# Altium project adau1979-fpga.PrjPcb (part 2 of 6)
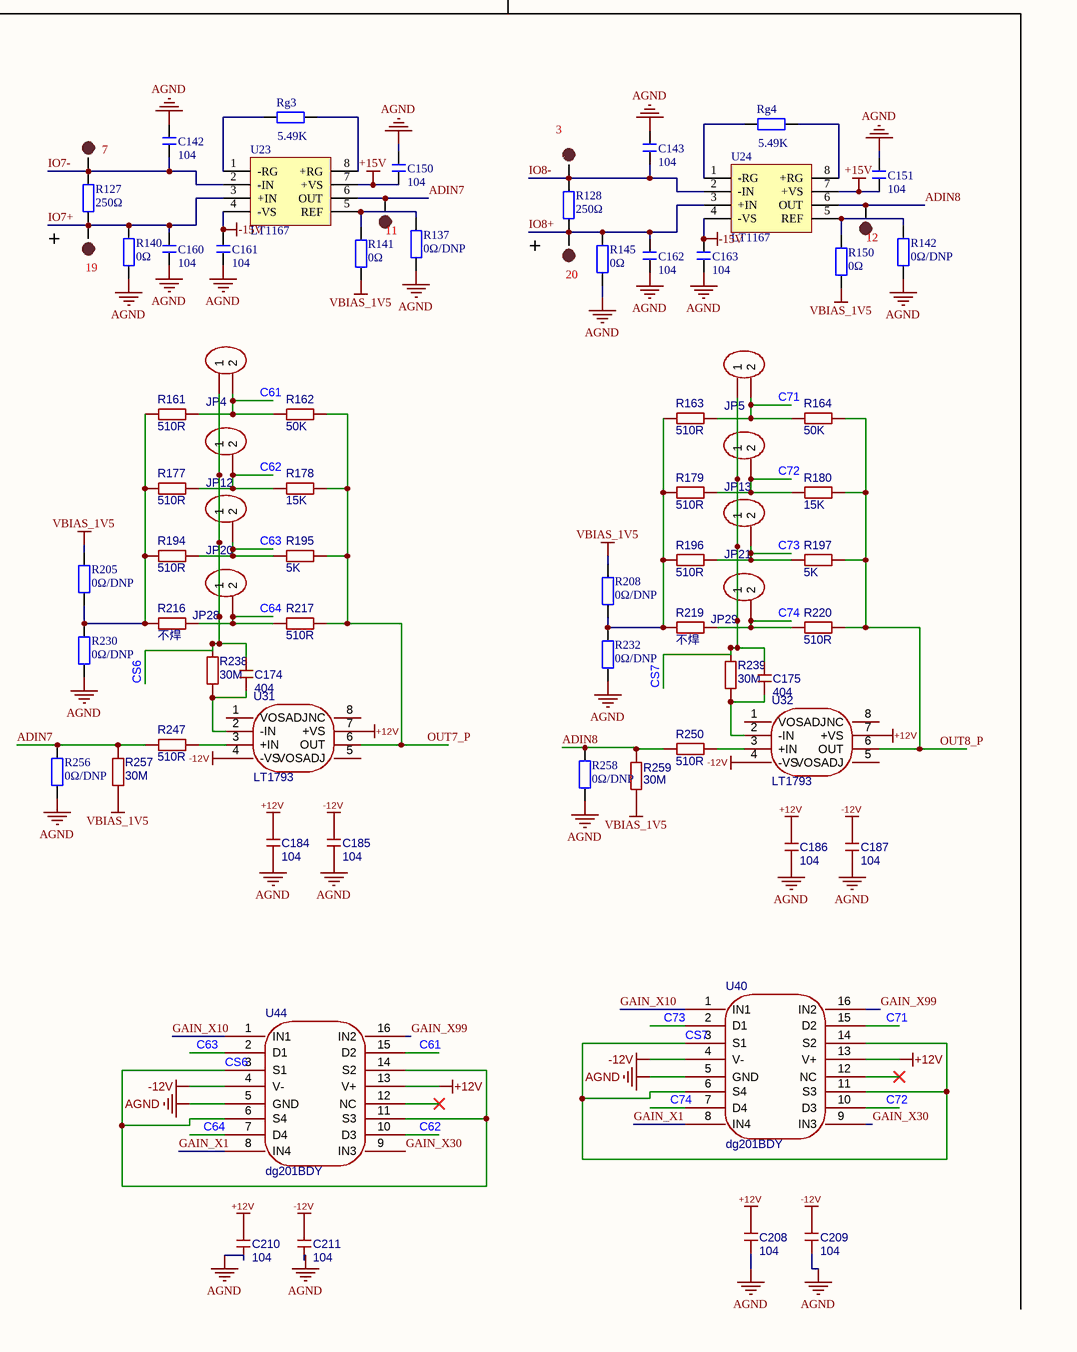
[diagram p8: adau1979_fpga.SchDoc, bottom right]
## Sheet adau1979_fpga.SchDoc (continued)
### Library data of the parts
1-24 +1 +2 -1--3 T1 = TEST-POINT: 测试点
C1-C7 = C: 贴片电容; BOM名称: 无极性贴片电容; 淘宝ID: 封装库来自淘宝 ID：黄晶宝石; Origin Footprint: C 0201_L; OriginFootprint 2: C 0402_L; OriginFootprint 3: C 0805_L; OriginFootprint 4: C 1206_L; OriginFootprint 5: C 1210_L; OriginFootprint 6: C 1808_L; OriginFootprint 7: C 1812_L; OriginFootprint 8: C 1825_L; OriginFootprint 9: C 2225_L; OriginFootprint 10: C 0201_M; OriginFootprint 11: C 0402_M; OriginFootprint 12: C 0603_M; OriginFootprint 13: C 0805_M; OriginFootprint 14: C 1206_M; OriginFootprint 15: C 1210_M; OriginFootprint 16: C 1808_M; OriginFootprint 17: C 1812_M; OriginFootprint 18: C 1825_M; OriginFootprint 19: C 2225_M; AddInBom: yes; OriginModelName: C 0603; Device: C; 联系售后，技术支持: https://shop463601444.taobao.com; 唯一出售店铺网址: https://shop463601444.taobao.com; DesignItemID: C; LibraryName: 0.1 - 电阻-电容-电感; Symbol: C; FootprintName: C 0603_L
C8-C13 C16-C29 C75 C77 C84-C86 C89 C91-C94 C102-C106 C110 C111 C113 C116 C118 C127-C130 C132 C133 C140-C171 = C: 贴片电容; BOM名称: 无极性贴片电容; 淘宝ID: 封装库来自淘宝 ID：黄晶宝石; 联系售后，技术支持: https://shop463601444.taobao.com; 唯一出售店铺网址: https://shop463601444.taobao.com
C14 C15 = CE_SMD: 贴片电解电容; 版权归属: 封装库来自淘宝 ID：黄晶宝石; BOM名称: 贴片电解电容; 联系售后: https://shop463601444.taobao.com
C30-C39 C41 C42 C45 C46 C48 C50 C53 C59 C61 C62 C66-C68 C71 C74 C78 C80 C81 C87 C90 C95 C98-C100 C108 C112 C115 C119 C120 C123 C125 C126 C134 C136 C138 C139 = C: 无极性贴片电容; 版权归属: 源创客; BOM名称: 无极性贴片电容; 学习资源: www.ooocke.com
C40 C52 C88 C131 = CAP_2
C43 C44 C47 C49 C54 C56 = CAP
C51 C64 C76 C83 C101 C109 C117 C124 = fs32x106k101egg: 容值:10uF;精度:±10%;额定电压:100V;温度系数:X7R;; Manufacturer: PSA(信昌电陶); AddInBom: yes; ModelId: 833068e7fe044595a6eec77c56179455; ModelName: C1210_L3.2-W2.5-H2.5; ModelTransform: 125.984,98.425,0,0,0,0,0,0,0; Tolerance: ±10%; Voltage Rating: 100V; Temperature Coefficient: X7R; Symbol: FS32X106K101EGG; LCSC Part Name: 10uF ±10% 100V; SupplierPart: C5156756; ManufacturerPart: FS32X106K101EGG; Supplier Footprint: 1210; JLCPCB Part Class: Extended Part; Datasheet: https://item.szlcsc.com/datasheet/FS32X106K101EGG/5791227.html; Supplier: LCSC; ConvertToPcb: yes; FootprintName: C1210; Value: 10uF
C55 C57 = Cap: Capacitor; Value: 104; Published: 8-Jun-2000; LatestRevisionDate: 17-Jul-2002; LatestRevisionNote: Re-released for DXP Platform.; Publisher: Altium Limited
C58 C73 C79 C97 C107 C114 C122 C137 = fs32x106k101egg: 容值:10uF;精度:±10%;额定电压:100V;温度系数:X7R;; Manufacturer: PSA(信昌电陶); AddInBom: yes; ModelId: 833068e7fe044595a6eec77c56179455; ModelName: C1210_L3.2-W2.5-H2.5; ModelTransform: 125.984,98.425,0,0,0,0,0,0,0; Value: 10uF; Tolerance: ±10%; Voltage Rating: 100V; Temperature Coefficient: X7R; Symbol: FS32X106K101EGG; LCSC Part Name: 10uF ±10% 100V; SupplierPart: C5156756; ManufacturerPart: FS32X106K101EGG; Supplier Footprint: 1210; JLCPCB Part Class: Extended Part; Datasheet: https://item.szlcsc.com/datasheet/FS32X106K101EGG/5791227.html; Supplier: LCSC; ConvertToPcb: yes; FootprintName: C1210
C60 C65 = 100yxj10m6.3x11: 容值:10uF;精度:±20%;额定电压:100V;纹波电流:112.14mA@120Hz;等效串联电阻(ESR):570mΩ;; Manufacturer: Rubycon(红宝石); AddInBom: yes; ModelId: 3cdd55eab6a840dba93006d5a727d063; ModelTransform: 247.778,247.90446,0,0,0,0,0,0,-137.795; Tolerance: ±20%; Voltage Rating: 100V; Equivalent Series Resistance(ESR): 570mΩ; Pin Spacing: 2.5mm; Lifetime: 7000hrs@105℃; Symbol: 100YXJ10M6.3X11; LCSC Part Name: 10uF ±20% 100V; SupplierPart: C1668981; ManufacturerPart: 100YXJ10M6.3X11; Supplier Footprint: 插件,D6.3xL11mm; JLCPCB Part Class: Extended Part; Supplier: LCSC; ConvertToPcb: yes; FootprintName: CAP-TH_BD6.3-P2.50-D0.6-FD; ModelName: CAP-TH_BD6.3-P2.50-D0.6-FD; Value: 10uF; Ripple Current: 112.14mA@120Hz; Diameter: 6.3mm; Height - Seated (Max): 11mm; Operating Temperature: -40℃~+105℃
C63 C69 C70 = eeufr1h101: 容值:100uF;精度:±20%;额定电压:50V;纹波电流:870mA@100kHz;等效串联电阻(ESR):61mΩ@100kHz;; Manufacturer: PANASONIC(松下); AddInBom: yes; ModelId: 5fc21599cab34df2ad7753b19b2f5286; ModelTransform: 315.365,314.914,0,0,0,0,0,0,-196.85; Tolerance: ±20%; Voltage Rating: 50V; Pin Spacing: 3.5mm; Lifetime: 6000hrs@105℃; Polarity type: 有极性; Symbol: EEUFR1H101; LCSC Part Name: 100uF ±20% 50V; SupplierPart: C178702; ManufacturerPart: EEUFR1H101; Supplier Footprint: 插件,D8xL11.5mm; JLCPCB Part Class: Extended Part; Datasheet: https://item.szlcsc.com/datasheet/EEUFR1H101/190095.html; Supplier: LCSC; ConvertToPcb: yes; FootprintName: CAP-TH_BD8.0-P3.50-D0.6-FD_1; ModelName: CAP-TH_BD8.0-P3.50-D0.6-FD_1; Value: 100uF; Ripple Current: 870mA@100kHz; Equivalent Series Resistance(ESR): 61mΩ@100kHz; Diameter: 8mm; Height - Seated (Max): 11.5mm; Operating Temperature: -40℃~+105℃
C72 = cl31b475kbhnnne: 容值:4.7uF;精度:±10%;额定电压:50V;温度系数:X7R;; Manufacturer: SAMSUNG(三星); AddInBom: yes; ModelId: e4be705b945545a48e666415e3682bd8; ModelName: C1206_L3.2-W1.6-H1.3; ModelTransform: 125.984,62.992,0,0,0,0,0,0,0; Tolerance: ±10%; Voltage Rating: 50V; Temperature Coefficient: X7R; Symbol: CL31B475KBHNNNE; LCSC Part Name: 4.7uF ±10% 50V; SupplierPart: C51205; ManufacturerPart: CL31B475KBHNNNE; Supplier Footprint: 1206; JLCPCB Part Class: Extended Part; Datasheet: https://item.szlcsc.com/datasheet/CL31B475KBHNNNE/52218.html; Supplier: LCSC; ConvertToPcb: yes; FootprintName: C1206; Value: 4.7uF
C82 C96 C121 C135 = cl31b106kahnnne: 容值:10uF;精度:±10%;额定电压:25V;温度系数:X7R;; Manufacturer: SAMSUNG(三星); AddInBom: yes; ModelId: e4be705b945545a48e666415e3682bd8; ModelName: C1206_L3.2-W1.6-H1.3; ModelTransform: 125.984,62.992,0,0,0,0,0,0,0; Tolerance: ±10%; Voltage Rating: 25V; Temperature Coefficient: X7R; Symbol: CL31B106KAHNNNE; LCSC Part Name: 10uF ±10% 25V; SupplierPart: C14860; ManufacturerPart: CL31B106KAHNNNE; Supplier Footprint: 1206; JLCPCB Part Class: Extended Part; Datasheet: https://item.szlcsc.com/datasheet/CL31B106KAHNNNE/15532.html; Supplier: LCSC; ConvertToPcb: yes; FootprintName: C1206; Value: 10uF
C172 = C: 贴片电容; BOM名称: 无极性贴片电容; 淘宝ID: 封装库来自淘宝 ID：黄晶宝石; Origin Footprint: C 0201_L; OriginFootprint 2: C 0402_L; OriginFootprint 3: C 0805_L; OriginFootprint 4: C 1206_L; OriginFootprint 5: C 1210_L; OriginFootprint 6: C 1808_L; OriginFootprint 7: C 1812_L; OriginFootprint 8: C 1825_L; OriginFootprint 9: C 2225_L; OriginFootprint 10: C 0201_M; OriginFootprint 11: C 0402_M; OriginFootprint 12: C 0603_M; OriginFootprint 13: C 0805_M; OriginFootprint 14: C 1206_M; OriginFootprint 15: C 1210_M; OriginFootprint 16: C 1808_M; OriginFootprint 17: C 1812_M; OriginFootprint 18: C 1825_M; OriginFootprint 19: C 2225_M; UniqueId: 2b2365c2d0e3ae99; AddInBom: yes; OriginModelName: C 0603; Device: C; 联系售后，技术支持: https://shop463601444.taobao.com; 唯一出售店铺网址: https://shop463601444.taobao.com; DesignItemID: C; LibraryName: 0.1 - 电阻-电容-电感; SymbolName: C; FootprintName: C 0603_L
C173 = C: 贴片电容; BOM名称: 无极性贴片电容; 淘宝ID: 封装库来自淘宝 ID：黄晶宝石; Origin Footprint: C 0201_L; OriginFootprint 2: C 0402_L; OriginFootprint 3: C 0805_L; OriginFootprint 4: C 1206_L; OriginFootprint 5: C 1210_L; OriginFootprint 6: C 1808_L; OriginFootprint 7: C 1812_L; OriginFootprint 8: C 1825_L; OriginFootprint 9: C 2225_L; OriginFootprint 10: C 0201_M; OriginFootprint 11: C 0402_M; OriginFootprint 12: C 0603_M; OriginFootprint 13: C 0805_M; OriginFootprint 14: C 1206_M; OriginFootprint 15: C 1210_M; OriginFootprint 16: C 1808_M; OriginFootprint 17: C 1812_M; OriginFootprint 18: C 1825_M; OriginFootprint 19: C 2225_M; UniqueId: 2ac4a713bdb27458; AddInBom: yes; OriginModelName: C 0603; Device: C; 联系售后，技术支持: https://shop463601444.taobao.com; 唯一出售店铺网址: https://shop463601444.taobao.com; DesignItemID: C; LibraryName: 0.1 - 电阻-电容-电感; SymbolName: C; FootprintName: C 0603_L
C174 = C: 贴片电容; BOM名称: 无极性贴片电容; 淘宝ID: 封装库来自淘宝 ID：黄晶宝石; Origin Footprint: C 0201_L; OriginFootprint 2: C 0402_L; OriginFootprint 3: C 0805_L; OriginFootprint 4: C 1206_L; OriginFootprint 5: C 1210_L; OriginFootprint 6: C 1808_L; OriginFootprint 7: C 1812_L; OriginFootprint 8: C 1825_L; OriginFootprint 9: C 2225_L; OriginFootprint 10: C 0201_M; OriginFootprint 11: C 0402_M; OriginFootprint 12: C 0603_M; OriginFootprint 13: C 0805_M; OriginFootprint 14: C 1206_M; OriginFootprint 15: C 1210_M; OriginFootprint 16: C 1808_M; OriginFootprint 17: C 1812_M; OriginFootprint 18: C 1825_M; OriginFootprint 19: C 2225_M; UniqueId: 043006a40a259ae3; AddInBom: yes; OriginModelName: C 0603; Device: C; 联系售后，技术支持: https://shop463601444.taobao.com; 唯一出售店铺网址: https://shop463601444.taobao.com; DesignItemID: C; LibraryName: 0.1 - 电阻-电容-电感; SymbolName: C; FootprintName: C 0603_L
C175 = C: 贴片电容; BOM名称: 无极性贴片电容; 淘宝ID: 封装库来自淘宝 ID：黄晶宝石; Origin Footprint: C 0201_L; OriginFootprint 2: C 0402_L; OriginFootprint 3: C 0805_L; OriginFootprint 4: C 1206_L; OriginFootprint 5: C 1210_L; OriginFootprint 6: C 1808_L; OriginFootprint 7: C 1812_L; OriginFootprint 8: C 1825_L; OriginFootprint 9: C 2225_L; OriginFootprint 10: C 0201_M; OriginFootprint 11: C 0402_M; OriginFootprint 12: C 0603_M; OriginFootprint 13: C 0805_M; OriginFootprint 14: C 1206_M; OriginFootprint 15: C 1210_M; OriginFootprint 16: C 1808_M; OriginFootprint 17: C 1812_M; OriginFootprint 18: C 1825_M; OriginFootprint 19: C 2225_M; UniqueId: ed052c5890e059ff; AddInBom: yes; OriginModelName: C 0603; Device: C; 联系售后，技术支持: https://shop463601444.taobao.com; 唯一出售店铺网址: https://shop463601444.taobao.com; DesignItemID: C; LibraryName: 0.1 - 电阻-电容-电感; SymbolName: C; FootprintName: C 0603_L
C176 = C: 贴片电容; BOM名称: 无极性贴片电容; 淘宝ID: 封装库来自淘宝 ID：黄晶宝石; Origin Footprint: C 0201_L; OriginFootprint 2: C 0402_L; OriginFootprint 3: C 0805_L; OriginFootprint 4: C 1206_L; OriginFootprint 5: C 1210_L; OriginFootprint 6: C 1808_L; OriginFootprint 7: C 1812_L; OriginFootprint 8: C 1825_L; OriginFootprint 9: C 2225_L; OriginFootprint 10: C 0201_M; OriginFootprint 11: C 0402_M; OriginFootprint 12: C 0603_M; OriginFootprint 13: C 0805_M; OriginFootprint 14: C 1206_M; OriginFootprint 15: C 1210_M; OriginFootprint 16: C 1808_M; OriginFootprint 17: C 1812_M; OriginFootprint 18: C 1825_M; OriginFootprint 19: C 2225_M; UniqueId: e3aeb17489c0ab5d; AddInBom: yes; OriginModelName: C 0603; Device: C; 联系售后，技术支持: https://shop463601444.taobao.com; 唯一出售店铺网址: https://shop463601444.taobao.com; DesignItemID: C; LibraryName: 0.1 - 电阻-电容-电感; SymbolName: C; FootprintName: C 0603_L
C177 = C: 贴片电容; BOM名称: 无极性贴片电容; 淘宝ID: 封装库来自淘宝 ID：黄晶宝石; Origin Footprint: C 0201_L; OriginFootprint 2: C 0402_L; OriginFootprint 3: C 0805_L; OriginFootprint 4: C 1206_L; OriginFootprint 5: C 1210_L; OriginFootprint 6: C 1808_L; OriginFootprint 7: C 1812_L; OriginFootprint 8: C 1825_L; OriginFootprint 9: C 2225_L; OriginFootprint 10: C 0201_M; OriginFootprint 11: C 0402_M; OriginFootprint 12: C 0603_M; OriginFootprint 13: C 0805_M; OriginFootprint 14: C 1206_M; OriginFootprint 15: C 1210_M; OriginFootprint 16: C 1808_M; OriginFootprint 17: C 1812_M; OriginFootprint 18: C 1825_M; OriginFootprint 19: C 2225_M; UniqueId: cc1d00c51cc12124; AddInBom: yes; OriginModelName: C 0603; Device: C; 联系售后，技术支持: https://shop463601444.taobao.com; 唯一出售店铺网址: https://shop463601444.taobao.com; DesignItemID: C; LibraryName: 0.1 - 电阻-电容-电感; SymbolName: C; FootprintName: C 0603_L
C178 = C: 贴片电容; BOM名称: 无极性贴片电容; 淘宝ID: 封装库来自淘宝 ID：黄晶宝石; Origin Footprint: C 0201_L; OriginFootprint 2: C 0402_L; OriginFootprint 3: C 0805_L; OriginFootprint 4: C 1206_L; OriginFootprint 5: C 1210_L; OriginFootprint 6: C 1808_L; OriginFootprint 7: C 1812_L; OriginFootprint 8: C 1825_L; OriginFootprint 9: C 2225_L; OriginFootprint 10: C 0201_M; OriginFootprint 11: C 0402_M; OriginFootprint 12: C 0603_M; OriginFootprint 13: C 0805_M; OriginFootprint 14: C 1206_M; OriginFootprint 15: C 1210_M; OriginFootprint 16: C 1808_M; OriginFootprint 17: C 1812_M; OriginFootprint 18: C 1825_M; OriginFootprint 19: C 2225_M; UniqueId: d2625f4b4bd439ef; AddInBom: yes; OriginModelName: C 0603; Device: C; 联系售后，技术支持: https://shop463601444.taobao.com; 唯一出售店铺网址: https://shop463601444.taobao.com; DesignItemID: C; LibraryName: 0.1 - 电阻-电容-电感; SymbolName: C; FootprintName: C 0603_L
C179 = C: 贴片电容; BOM名称: 无极性贴片电容; 淘宝ID: 封装库来自淘宝 ID：黄晶宝石; Origin Footprint: C 0201_L; OriginFootprint 2: C 0402_L; OriginFootprint 3: C 0805_L; OriginFootprint 4: C 1206_L; OriginFootprint 5: C 1210_L; OriginFootprint 6: C 1808_L; OriginFootprint 7: C 1812_L; OriginFootprint 8: C 1825_L; OriginFootprint 9: C 2225_L; OriginFootprint 10: C 0201_M; OriginFootprint 11: C 0402_M; OriginFootprint 12: C 0603_M; OriginFootprint 13: C 0805_M; OriginFootprint 14: C 1206_M; OriginFootprint 15: C 1210_M; OriginFootprint 16: C 1808_M; OriginFootprint 17: C 1812_M; OriginFootprint 18: C 1825_M; OriginFootprint 19: C 2225_M; UniqueId: a26eb100929f0697; AddInBom: yes; OriginModelName: C 0603; Device: C; 联系售后，技术支持: https://shop463601444.taobao.com; 唯一出售店铺网址: https://shop463601444.taobao.com; DesignItemID: C; LibraryName: 0.1 - 电阻-电容-电感; SymbolName: C; FootprintName: C 0603_L
C180 = C: 贴片电容; BOM名称: 无极性贴片电容; 淘宝ID: 封装库来自淘宝 ID：黄晶宝石; Origin Footprint: C 0201_L; OriginFootprint 2: C 0402_L; OriginFootprint 3: C 0805_L; OriginFootprint 4: C 1206_L; OriginFootprint 5: C 1210_L; OriginFootprint 6: C 1808_L; OriginFootprint 7: C 1812_L; OriginFootprint 8: C 1825_L; OriginFootprint 9: C 2225_L; OriginFootprint 10: C 0201_M; OriginFootprint 11: C 0402_M; OriginFootprint 12: C 0603_M; OriginFootprint 13: C 0805_M; OriginFootprint 14: C 1206_M; OriginFootprint 15: C 1210_M; OriginFootprint 16: C 1808_M; OriginFootprint 17: C 1812_M; OriginFootprint 18: C 1825_M; OriginFootprint 19: C 2225_M; UniqueId: 6158349470ed1956; AddInBom: yes; OriginModelName: C 0603; Device: C; 联系售后，技术支持: https://shop463601444.taobao.com; 唯一出售店铺网址: https://shop463601444.taobao.com; DesignItemID: C; LibraryName: 0.1 - 电阻-电容-电感; SymbolName: C; FootprintName: C 0603_L
C181 = C: 贴片电容; BOM名称: 无极性贴片电容; 淘宝ID: 封装库来自淘宝 ID：黄晶宝石; Origin Footprint: C 0201_L; OriginFootprint 2: C 0402_L; OriginFootprint 3: C 0805_L; OriginFootprint 4: C 1206_L; OriginFootprint 5: C 1210_L; OriginFootprint 6: C 1808_L; OriginFootprint 7: C 1812_L; OriginFootprint 8: C 1825_L; OriginFootprint 9: C 2225_L; OriginFootprint 10: C 0201_M; OriginFootprint 11: C 0402_M; OriginFootprint 12: C 0603_M; OriginFootprint 13: C 0805_M; OriginFootprint 14: C 1206_M; OriginFootprint 15: C 1210_M; OriginFootprint 16: C 1808_M; OriginFootprint 17: C 1812_M; OriginFootprint 18: C 1825_M; OriginFootprint 19: C 2225_M; UniqueId: de488198406d19e5; AddInBom: yes; OriginModelName: C 0603; Device: C; 联系售后，技术支持: https://shop463601444.taobao.com; 唯一出售店铺网址: https://shop463601444.taobao.com; DesignItemID: C; LibraryName: 0.1 - 电阻-电容-电感; SymbolName: C; FootprintName: C 0603_L
C182 = C: 贴片电容; BOM名称: 无极性贴片电容; 淘宝ID: 封装库来自淘宝 ID：黄晶宝石; Origin Footprint: C 0201_L; OriginFootprint 2: C 0402_L; OriginFootprint 3: C 0805_L; OriginFootprint 4: C 1206_L; OriginFootprint 5: C 1210_L; OriginFootprint 6: C 1808_L; OriginFootprint 7: C 1812_L; OriginFootprint 8: C 1825_L; OriginFootprint 9: C 2225_L; OriginFootprint 10: C 0201_M; OriginFootprint 11: C 0402_M; OriginFootprint 12: C 0603_M; OriginFootprint 13: C 0805_M; OriginFootprint 14: C 1206_M; OriginFootprint 15: C 1210_M; OriginFootprint 16: C 1808_M; OriginFootprint 17: C 1812_M; OriginFootprint 18: C 1825_M; OriginFootprint 19: C 2225_M; UniqueId: ac7cf9eb5671d2c3; AddInBom: yes; OriginModelName: C 0603; Device: C; 联系售后，技术支持: https://shop463601444.taobao.com; 唯一出售店铺网址: https://shop463601444.taobao.com; DesignItemID: C; LibraryName: 0.1 - 电阻-电容-电感; SymbolName: C; FootprintName: C 0603_L
C183 = C: 贴片电容; BOM名称: 无极性贴片电容; 淘宝ID: 封装库来自淘宝 ID：黄晶宝石; Origin Footprint: C 0201_L; OriginFootprint 2: C 0402_L; OriginFootprint 3: C 0805_L; OriginFootprint 4: C 1206_L; OriginFootprint 5: C 1210_L; OriginFootprint 6: C 1808_L; OriginFootprint 7: C 1812_L; OriginFootprint 8: C 1825_L; OriginFootprint 9: C 2225_L; OriginFootprint 10: C 0201_M; OriginFootprint 11: C 0402_M; OriginFootprint 12: C 0603_M; OriginFootprint 13: C 0805_M; OriginFootprint 14: C 1206_M; OriginFootprint 15: C 1210_M; OriginFootprint 16: C 1808_M; OriginFootprint 17: C 1812_M; OriginFootprint 18: C 1825_M; OriginFootprint 19: C 2225_M; UniqueId: 5471cb5e6ead650e; AddInBom: yes; OriginModelName: C 0603; Device: C; 联系售后，技术支持: https://shop463601444.taobao.com; 唯一出售店铺网址: https://shop463601444.taobao.com; DesignItemID: C; LibraryName: 0.1 - 电阻-电容-电感; SymbolName: C; FootprintName: C 0603_L
C184 = C: 贴片电容; BOM名称: 无极性贴片电容; 淘宝ID: 封装库来自淘宝 ID：黄晶宝石; Origin Footprint: C 0201_L; OriginFootprint 2: C 0402_L; OriginFootprint 3: C 0805_L; OriginFootprint 4: C 1206_L; OriginFootprint 5: C 1210_L; OriginFootprint 6: C 1808_L; OriginFootprint 7: C 1812_L; OriginFootprint 8: C 1825_L; OriginFootprint 9: C 2225_L; OriginFootprint 10: C 0201_M; OriginFootprint 11: C 0402_M; OriginFootprint 12: C 0603_M; OriginFootprint 13: C 0805_M; OriginFootprint 14: C 1206_M; OriginFootprint 15: C 1210_M; OriginFootprint 16: C 1808_M; OriginFootprint 17: C 1812_M; OriginFootprint 18: C 1825_M; OriginFootprint 19: C 2225_M; UniqueId: 909660952e1a96fd; AddInBom: yes; OriginModelName: C 0603; Device: C; 联系售后，技术支持: https://shop463601444.taobao.com; 唯一出售店铺网址: https://shop463601444.taobao.com; DesignItemID: C; LibraryName: 0.1 - 电阻-电容-电感; SymbolName: C; FootprintName: C 0603_L
C185 = C: 贴片电容; BOM名称: 无极性贴片电容; 淘宝ID: 封装库来自淘宝 ID：黄晶宝石; Origin Footprint: C 0201_L; OriginFootprint 2: C 0402_L; OriginFootprint 3: C 0805_L; OriginFootprint 4: C 1206_L; OriginFootprint 5: C 1210_L; OriginFootprint 6: C 1808_L; OriginFootprint 7: C 1812_L; OriginFootprint 8: C 1825_L; OriginFootprint 9: C 2225_L; OriginFootprint 10: C 0201_M; OriginFootprint 11: C 0402_M; OriginFootprint 12: C 0603_M; OriginFootprint 13: C 0805_M; OriginFootprint 14: C 1206_M; OriginFootprint 15: C 1210_M; OriginFootprint 16: C 1808_M; OriginFootprint 17: C 1812_M; OriginFootprint 18: C 1825_M; OriginFootprint 19: C 2225_M; UniqueId: 7abe426619a81940; AddInBom: yes; OriginModelName: C 0603; Device: C; 联系售后，技术支持: https://shop463601444.taobao.com; 唯一出售店铺网址: https://shop463601444.taobao.com; DesignItemID: C; LibraryName: 0.1 - 电阻-电容-电感; SymbolName: C; FootprintName: C 0603_L
C186 = C: 贴片电容; BOM名称: 无极性贴片电容; 淘宝ID: 封装库来自淘宝 ID：黄晶宝石; Origin Footprint: C 0201_L; OriginFootprint 2: C 0402_L; OriginFootprint 3: C 0805_L; OriginFootprint 4: C 1206_L; OriginFootprint 5: C 1210_L; OriginFootprint 6: C 1808_L; OriginFootprint 7: C 1812_L; OriginFootprint 8: C 1825_L; OriginFootprint 9: C 2225_L; OriginFootprint 10: C 0201_M; OriginFootprint 11: C 0402_M; OriginFootprint 12: C 0603_M; OriginFootprint 13: C 0805_M; OriginFootprint 14: C 1206_M; OriginFootprint 15: C 1210_M; OriginFootprint 16: C 1808_M; OriginFootprint 17: C 1812_M; OriginFootprint 18: C 1825_M; OriginFootprint 19: C 2225_M; UniqueId: f9bfd7a6531d354d; AddInBom: yes; OriginModelName: C 0603; Device: C; 联系售后，技术支持: https://shop463601444.taobao.com; 唯一出售店铺网址: https://shop463601444.taobao.com; DesignItemID: C; LibraryName: 0.1 - 电阻-电容-电感; SymbolName: C; FootprintName: C 0603_L
C187 = C: 贴片电容; BOM名称: 无极性贴片电容; 淘宝ID: 封装库来自淘宝 ID：黄晶宝石; Origin Footprint: C 0201_L; OriginFootprint 2: C 0402_L; OriginFootprint 3: C 0805_L; OriginFootprint 4: C 1206_L; OriginFootprint 5: C 1210_L; OriginFootprint 6: C 1808_L; OriginFootprint 7: C 1812_L; OriginFootprint 8: C 1825_L; OriginFootprint 9: C 2225_L; OriginFootprint 10: C 0201_M; OriginFootprint 11: C 0402_M; OriginFootprint 12: C 0603_M; OriginFootprint 13: C 0805_M; OriginFootprint 14: C 1206_M; OriginFootprint 15: C 1210_M; OriginFootprint 16: C 1808_M; OriginFootprint 17: C 1812_M; OriginFootprint 18: C 1825_M; OriginFootprint 19: C 2225_M; UniqueId: ecf0d2211b923647; AddInBom: yes; OriginModelName: C 0603; Device: C; 联系售后，技术支持: https://shop463601444.taobao.com; 唯一出售店铺网址: https://shop463601444.taobao.com; DesignItemID: C; LibraryName: 0.1 - 电阻-电容-电感; SymbolName: C; FootprintName: C 0603_L
C188 = C: 贴片电容; BOM名称: 无极性贴片电容; 淘宝ID: 封装库来自淘宝 ID：黄晶宝石; Origin Footprint: C 0201_L; OriginFootprint 2: C 0402_L; OriginFootprint 3: C 0805_L; OriginFootprint 4: C 1206_L; OriginFootprint 5: C 1210_L; OriginFootprint 6: C 1808_L; OriginFootprint 7: C 1812_L; OriginFootprint 8: C 1825_L; OriginFootprint 9: C 2225_L; OriginFootprint 10: C 0201_M; OriginFootprint 11: C 0402_M; OriginFootprint 12: C 0603_M; OriginFootprint 13: C 0805_M; OriginFootprint 14: C 1206_M; OriginFootprint 15: C 1210_M; OriginFootprint 16: C 1808_M; OriginFootprint 17: C 1812_M; OriginFootprint 18: C 1825_M; OriginFootprint 19: C 2225_M; UniqueId: a2ee6ceb65d30336; AddInBom: yes; OriginModelName: C 0603; Device: C; 联系售后，技术支持: https://shop463601444.taobao.com; 唯一出售店铺网址: https://shop463601444.taobao.com; DesignItemID: C; LibraryName: 0.1 - 电阻-电容-电感; SymbolName: C; FootprintName: C 0603_L
C189 = C: 贴片电容; BOM名称: 无极性贴片电容; 淘宝ID: 封装库来自淘宝 ID：黄晶宝石; Origin Footprint: C 0201_L; OriginFootprint 2: C 0402_L; OriginFootprint 3: C 0805_L; OriginFootprint 4: C 1206_L; OriginFootprint 5: C 1210_L; OriginFootprint 6: C 1808_L; OriginFootprint 7: C 1812_L; OriginFootprint 8: C 1825_L; OriginFootprint 9: C 2225_L; OriginFootprint 10: C 0201_M; OriginFootprint 11: C 0402_M; OriginFootprint 12: C 0603_M; OriginFootprint 13: C 0805_M; OriginFootprint 14: C 1206_M; OriginFootprint 15: C 1210_M; OriginFootprint 16: C 1808_M; OriginFootprint 17: C 1812_M; OriginFootprint 18: C 1825_M; OriginFootprint 19: C 2225_M; UniqueId: ff078052695da6b6; AddInBom: yes; OriginModelName: C 0603; Device: C; 联系售后，技术支持: https://shop463601444.taobao.com; 唯一出售店铺网址: https://shop463601444.taobao.com; DesignItemID: C; LibraryName: 0.1 - 电阻-电容-电感; SymbolName: C; FootprintName: C 0603_L
C190 = C: 贴片电容; BOM名称: 无极性贴片电容; 淘宝ID: 封装库来自淘宝 ID：黄晶宝石; Origin Footprint: C 0201_L; OriginFootprint 2: C 0402_L; OriginFootprint 3: C 0805_L; OriginFootprint 4: C 1206_L; OriginFootprint 5: C 1210_L; OriginFootprint 6: C 1808_L; OriginFootprint 7: C 1812_L; OriginFootprint 8: C 1825_L; OriginFootprint 9: C 2225_L; OriginFootprint 10: C 0201_M; OriginFootprint 11: C 0402_M; OriginFootprint 12: C 0603_M; OriginFootprint 13: C 0805_M; OriginFootprint 14: C 1206_M; OriginFootprint 15: C 1210_M; OriginFootprint 16: C 1808_M; OriginFootprint 17: C 1812_M; OriginFootprint 18: C 1825_M; OriginFootprint 19: C 2225_M; UniqueId: 553def7d7947fca6; AddInBom: yes; OriginModelName: C 0603; Device: C; 联系售后，技术支持: https://shop463601444.taobao.com; 唯一出售店铺网址: https://shop463601444.taobao.com; DesignItemID: C; LibraryName: 0.1 - 电阻-电容-电感; SymbolName: C; FootprintName: C 0603_L
C191 = C: 贴片电容; BOM名称: 无极性贴片电容; 淘宝ID: 封装库来自淘宝 ID：黄晶宝石; Origin Footprint: C 0201_L; OriginFootprint 2: C 0402_L; OriginFootprint 3: C 0805_L; OriginFootprint 4: C 1206_L; OriginFootprint 5: C 1210_L; OriginFootprint 6: C 1808_L; OriginFootprint 7: C 1812_L; OriginFootprint 8: C 1825_L; OriginFootprint 9: C 2225_L; OriginFootprint 10: C 0201_M; OriginFootprint 11: C 0402_M; OriginFootprint 12: C 0603_M; OriginFootprint 13: C 0805_M; OriginFootprint 14: C 1206_M; OriginFootprint 15: C 1210_M; OriginFootprint 16: C 1808_M; OriginFootprint 17: C 1812_M; OriginFootprint 18: C 1825_M; OriginFootprint 19: C 2225_M; UniqueId: 54d3d224326b3f8f; AddInBom: yes; OriginModelName: C 0603; Device: C; 联系售后，技术支持: https://shop463601444.taobao.com; 唯一出售店铺网址: https://shop463601444.taobao.com; DesignItemID: C; LibraryName: 0.1 - 电阻-电容-电感; SymbolName: C; FootprintName: C 0603_L
C192 = C: 贴片电容; BOM名称: 无极性贴片电容; 淘宝ID: 封装库来自淘宝 ID：黄晶宝石; Origin Footprint: C 0201_L; OriginFootprint 2: C 0402_L; OriginFootprint 3: C 0805_L; OriginFootprint 4: C 1206_L; OriginFootprint 5: C 1210_L; OriginFootprint 6: C 1808_L; OriginFootprint 7: C 1812_L; OriginFootprint 8: C 1825_L; OriginFootprint 9: C 2225_L; OriginFootprint 10: C 0201_M; OriginFootprint 11: C 0402_M; OriginFootprint 12: C 0603_M; OriginFootprint 13: C 0805_M; OriginFootprint 14: C 1206_M; OriginFootprint 15: C 1210_M; OriginFootprint 16: C 1808_M; OriginFootprint 17: C 1812_M; OriginFootprint 18: C 1825_M; OriginFootprint 19: C 2225_M; UniqueId: 2b4e6e580c7acde0; AddInBom: yes; OriginModelName: C 0603; Device: C; 联系售后，技术支持: https://shop463601444.taobao.com; 唯一出售店铺网址: https://shop463601444.taobao.com; DesignItemID: C; LibraryName: 0.1 - 电阻-电容-电感; SymbolName: C; FootprintName: C 0603_L
C193 = C: 贴片电容; BOM名称: 无极性贴片电容; 淘宝ID: 封装库来自淘宝 ID：黄晶宝石; Origin Footprint: C 0201_L; OriginFootprint 2: C 0402_L; OriginFootprint 3: C 0805_L; OriginFootprint 4: C 1206_L; OriginFootprint 5: C 1210_L; OriginFootprint 6: C 1808_L; OriginFootprint 7: C 1812_L; OriginFootprint 8: C 1825_L; OriginFootprint 9: C 2225_L; OriginFootprint 10: C 0201_M; OriginFootprint 11: C 0402_M; OriginFootprint 12: C 0603_M; OriginFootprint 13: C 0805_M; OriginFootprint 14: C 1206_M; OriginFootprint 15: C 1210_M; OriginFootprint 16: C 1808_M; OriginFootprint 17: C 1812_M; OriginFootprint 18: C 1825_M; OriginFootprint 19: C 2225_M; UniqueId: 12af2948e5a85261; AddInBom: yes; OriginModelName: C 0603; Device: C; 联系售后，技术支持: https://shop463601444.taobao.com; 唯一出售店铺网址: https://shop463601444.taobao.com; DesignItemID: C; LibraryName: 0.1 - 电阻-电容-电感; SymbolName: C; FootprintName: C 0603_L
C194 = C: 贴片电容; BOM名称: 无极性贴片电容; 淘宝ID: 封装库来自淘宝 ID：黄晶宝石; Origin Footprint: C 0201_L; OriginFootprint 2: C 0402_L; OriginFootprint 3: C 0805_L; OriginFootprint 4: C 1206_L; OriginFootprint 5: C 1210_L; OriginFootprint 6: C 1808_L; OriginFootprint 7: C 1812_L; OriginFootprint 8: C 1825_L; OriginFootprint 9: C 2225_L; OriginFootprint 10: C 0201_M; OriginFootprint 11: C 0402_M; OriginFootprint 12: C 0603_M; OriginFootprint 13: C 0805_M; OriginFootprint 14: C 1206_M; OriginFootprint 15: C 1210_M; OriginFootprint 16: C 1808_M; OriginFootprint 17: C 1812_M; OriginFootprint 18: C 1825_M; OriginFootprint 19: C 2225_M; UniqueId: 5bfcee5f0e3d202c; AddInBom: yes; OriginModelName: C 0603; Device: C; 联系售后，技术支持: https://shop463601444.taobao.com; 唯一出售店铺网址: https://shop463601444.taobao.com; DesignItemID: C; LibraryName: 0.1 - 电阻-电容-电感; SymbolName: C; FootprintName: C 0603_L
C195 = C: 贴片电容; BOM名称: 无极性贴片电容; 淘宝ID: 封装库来自淘宝 ID：黄晶宝石; Origin Footprint: C 0201_L; OriginFootprint 2: C 0402_L; OriginFootprint 3: C 0805_L; OriginFootprint 4: C 1206_L; OriginFootprint 5: C 1210_L; OriginFootprint 6: C 1808_L; OriginFootprint 7: C 1812_L; OriginFootprint 8: C 1825_L; OriginFootprint 9: C 2225_L; OriginFootprint 10: C 0201_M; OriginFootprint 11: C 0402_M; OriginFootprint 12: C 0603_M; OriginFootprint 13: C 0805_M; OriginFootprint 14: C 1206_M; OriginFootprint 15: C 1210_M; OriginFootprint 16: C 1808_M; OriginFootprint 17: C 1812_M; OriginFootprint 18: C 1825_M; OriginFootprint 19: C 2225_M; UniqueId: 3db1f6a400993974; AddInBom: yes; OriginModelName: C 0603; Device: C; 联系售后，技术支持: https://shop463601444.taobao.com; 唯一出售店铺网址: https://shop463601444.taobao.com; DesignItemID: C; LibraryName: 0.1 - 电阻-电容-电感; SymbolName: C; FootprintName: C 0603_L
C196 = C: 贴片电容; BOM名称: 无极性贴片电容; 淘宝ID: 封装库来自淘宝 ID：黄晶宝石; Origin Footprint: C 0201_L; OriginFootprint 2: C 0402_L; OriginFootprint 3: C 0805_L; OriginFootprint 4: C 1206_L; OriginFootprint 5: C 1210_L; OriginFootprint 6: C 1808_L; OriginFootprint 7: C 1812_L; OriginFootprint 8: C 1825_L; OriginFootprint 9: C 2225_L; OriginFootprint 10: C 0201_M; OriginFootprint 11: C 0402_M; OriginFootprint 12: C 0603_M; OriginFootprint 13: C 0805_M; OriginFootprint 14: C 1206_M; OriginFootprint 15: C 1210_M; OriginFootprint 16: C 1808_M; OriginFootprint 17: C 1812_M; OriginFootprint 18: C 1825_M; OriginFootprint 19: C 2225_M; UniqueId: e068690e94c157bc; AddInBom: yes; OriginModelName: C 0603; Device: C; 联系售后，技术支持: https://shop463601444.taobao.com; 唯一出售店铺网址: https://shop463601444.taobao.com; DesignItemID: C; LibraryName: 0.1 - 电阻-电容-电感; SymbolName: C; FootprintName: C 0603_L
C197 = C: 贴片电容; BOM名称: 无极性贴片电容; 淘宝ID: 封装库来自淘宝 ID：黄晶宝石; Origin Footprint: C 0201_L; OriginFootprint 2: C 0402_L; OriginFootprint 3: C 0805_L; OriginFootprint 4: C 1206_L; OriginFootprint 5: C 1210_L; OriginFootprint 6: C 1808_L; OriginFootprint 7: C 1812_L; OriginFootprint 8: C 1825_L; OriginFootprint 9: C 2225_L; OriginFootprint 10: C 0201_M; OriginFootprint 11: C 0402_M; OriginFootprint 12: C 0603_M; OriginFootprint 13: C 0805_M; OriginFootprint 14: C 1206_M; OriginFootprint 15: C 1210_M; OriginFootprint 16: C 1808_M; OriginFootprint 17: C 1812_M; OriginFootprint 18: C 1825_M; OriginFootprint 19: C 2225_M; UniqueId: 60b913fe2234996d; AddInBom: yes; OriginModelName: C 0603; Device: C; 联系售后，技术支持: https://shop463601444.taobao.com; 唯一出售店铺网址: https://shop463601444.taobao.com; DesignItemID: C; LibraryName: 0.1 - 电阻-电容-电感; SymbolName: C; FootprintName: C 0603_L
C198 = C: 贴片电容; BOM名称: 无极性贴片电容; 淘宝ID: 封装库来自淘宝 ID：黄晶宝石; Origin Footprint: C 0201_L; OriginFootprint 2: C 0402_L; OriginFootprint 3: C 0805_L; OriginFootprint 4: C 1206_L; OriginFootprint 5: C 1210_L; OriginFootprint 6: C 1808_L; OriginFootprint 7: C 1812_L; OriginFootprint 8: C 1825_L; OriginFootprint 9: C 2225_L; OriginFootprint 10: C 0201_M; OriginFootprint 11: C 0402_M; OriginFootprint 12: C 0603_M; OriginFootprint 13: C 0805_M; OriginFootprint 14: C 1206_M; OriginFootprint 15: C 1210_M; OriginFootprint 16: C 1808_M; OriginFootprint 17: C 1812_M; OriginFootprint 18: C 1825_M; OriginFootprint 19: C 2225_M; UniqueId: 5298304991856aac; AddInBom: yes; OriginModelName: C 0603; Device: C; 联系售后，技术支持: https://shop463601444.taobao.com; 唯一出售店铺网址: https://shop463601444.taobao.com; DesignItemID: C; LibraryName: 0.1 - 电阻-电容-电感; SymbolName: C; FootprintName: C 0603_L
C199 = C: 贴片电容; BOM名称: 无极性贴片电容; 淘宝ID: 封装库来自淘宝 ID：黄晶宝石; Origin Footprint: C 0201_L; OriginFootprint 2: C 0402_L; OriginFootprint 3: C 0805_L; OriginFootprint 4: C 1206_L; OriginFootprint 5: C 1210_L; OriginFootprint 6: C 1808_L; OriginFootprint 7: C 1812_L; OriginFootprint 8: C 1825_L; OriginFootprint 9: C 2225_L; OriginFootprint 10: C 0201_M; OriginFootprint 11: C 0402_M; OriginFootprint 12: C 0603_M; OriginFootprint 13: C 0805_M; OriginFootprint 14: C 1206_M; OriginFootprint 15: C 1210_M; OriginFootprint 16: C 1808_M; OriginFootprint 17: C 1812_M; OriginFootprint 18: C 1825_M; OriginFootprint 19: C 2225_M; UniqueId: cd91d26fa4917fbf; AddInBom: yes; OriginModelName: C 0603; Device: C; 联系售后，技术支持: https://shop463601444.taobao.com; 唯一出售店铺网址: https://shop463601444.taobao.com; DesignItemID: C; LibraryName: 0.1 - 电阻-电容-电感; SymbolName: C; FootprintName: C 0603_L
C200 = C: 贴片电容; BOM名称: 无极性贴片电容; 淘宝ID: 封装库来自淘宝 ID：黄晶宝石; Origin Footprint: C 0201_L; OriginFootprint 2: C 0402_L; OriginFootprint 3: C 0805_L; OriginFootprint 4: C 1206_L; OriginFootprint 5: C 1210_L; OriginFootprint 6: C 1808_L; OriginFootprint 7: C 1812_L; OriginFootprint 8: C 1825_L; OriginFootprint 9: C 2225_L; OriginFootprint 10: C 0201_M; OriginFootprint 11: C 0402_M; OriginFootprint 12: C 0603_M; OriginFootprint 13: C 0805_M; OriginFootprint 14: C 1206_M; OriginFootprint 15: C 1210_M; OriginFootprint 16: C 1808_M; OriginFootprint 17: C 1812_M; OriginFootprint 18: C 1825_M; OriginFootprint 19: C 2225_M; UniqueId: 485846f0059d8f41; AddInBom: yes; OriginModelName: C 0603; Device: C; 联系售后，技术支持: https://shop463601444.taobao.com; 唯一出售店铺网址: https://shop463601444.taobao.com; DesignItemID: C; LibraryName: 0.1 - 电阻-电容-电感; SymbolName: C; FootprintName: C 0603_L
C201 = C: 贴片电容; BOM名称: 无极性贴片电容; 淘宝ID: 封装库来自淘宝 ID：黄晶宝石; Origin Footprint: C 0201_L; OriginFootprint 2: C 0402_L; OriginFootprint 3: C 0805_L; OriginFootprint 4: C 1206_L; OriginFootprint 5: C 1210_L; OriginFootprint 6: C 1808_L; OriginFootprint 7: C 1812_L; OriginFootprint 8: C 1825_L; OriginFootprint 9: C 2225_L; OriginFootprint 10: C 0201_M; OriginFootprint 11: C 0402_M; OriginFootprint 12: C 0603_M; OriginFootprint 13: C 0805_M; OriginFootprint 14: C 1206_M; OriginFootprint 15: C 1210_M; OriginFootprint 16: C 1808_M; OriginFootprint 17: C 1812_M; OriginFootprint 18: C 1825_M; OriginFootprint 19: C 2225_M; UniqueId: 7c578440d25b8116; AddInBom: yes; OriginModelName: C 0603; Device: C; 联系售后，技术支持: https://shop463601444.taobao.com; 唯一出售店铺网址: https://shop463601444.taobao.com; DesignItemID: C; LibraryName: 0.1 - 电阻-电容-电感; SymbolName: C; FootprintName: C 0603_L
C202 = C: 贴片电容; BOM名称: 无极性贴片电容; 淘宝ID: 封装库来自淘宝 ID：黄晶宝石; Origin Footprint: C 0201_L; OriginFootprint 2: C 0402_L; OriginFootprint 3: C 0805_L; OriginFootprint 4: C 1206_L; OriginFootprint 5: C 1210_L; OriginFootprint 6: C 1808_L; OriginFootprint 7: C 1812_L; OriginFootprint 8: C 1825_L; OriginFootprint 9: C 2225_L; OriginFootprint 10: C 0201_M; OriginFootprint 11: C 0402_M; OriginFootprint 12: C 0603_M; OriginFootprint 13: C 0805_M; OriginFootprint 14: C 1206_M; OriginFootprint 15: C 1210_M; OriginFootprint 16: C 1808_M; OriginFootprint 17: C 1812_M; OriginFootprint 18: C 1825_M; OriginFootprint 19: C 2225_M; UniqueId: 09d5d64189419707; AddInBom: yes; OriginModelName: C 0603; Device: C; 联系售后，技术支持: https://shop463601444.taobao.com; 唯一出售店铺网址: https://shop463601444.taobao.com; DesignItemID: C; LibraryName: 0.1 - 电阻-电容-电感; SymbolName: C; FootprintName: C 0603_L
C203 = C: 贴片电容; BOM名称: 无极性贴片电容; 淘宝ID: 封装库来自淘宝 ID：黄晶宝石; Origin Footprint: C 0201_L; OriginFootprint 2: C 0402_L; OriginFootprint 3: C 0805_L; OriginFootprint 4: C 1206_L; OriginFootprint 5: C 1210_L; OriginFootprint 6: C 1808_L; OriginFootprint 7: C 1812_L; OriginFootprint 8: C 1825_L; OriginFootprint 9: C 2225_L; OriginFootprint 10: C 0201_M; OriginFootprint 11: C 0402_M; OriginFootprint 12: C 0603_M; OriginFootprint 13: C 0805_M; OriginFootprint 14: C 1206_M; OriginFootprint 15: C 1210_M; OriginFootprint 16: C 1808_M; OriginFootprint 17: C 1812_M; OriginFootprint 18: C 1825_M; OriginFootprint 19: C 2225_M; UniqueId: a4fa6dbd8546cc48; AddInBom: yes; OriginModelName: C 0603; Device: C; 联系售后，技术支持: https://shop463601444.taobao.com; 唯一出售店铺网址: https://shop463601444.taobao.com; DesignItemID: C; LibraryName: 0.1 - 电阻-电容-电感; SymbolName: C; FootprintName: C 0603_L
C204 = C: 贴片电容; BOM名称: 无极性贴片电容; 淘宝ID: 封装库来自淘宝 ID：黄晶宝石; Origin Footprint: C 0201_L; OriginFootprint 2: C 0402_L; OriginFootprint 3: C 0805_L; OriginFootprint 4: C 1206_L; OriginFootprint 5: C 1210_L; OriginFootprint 6: C 1808_L; OriginFootprint 7: C 1812_L; OriginFootprint 8: C 1825_L; OriginFootprint 9: C 2225_L; OriginFootprint 10: C 0201_M; OriginFootprint 11: C 0402_M; OriginFootprint 12: C 0603_M; OriginFootprint 13: C 0805_M; OriginFootprint 14: C 1206_M; OriginFootprint 15: C 1210_M; OriginFootprint 16: C 1808_M; OriginFootprint 17: C 1812_M; OriginFootprint 18: C 1825_M; OriginFootprint 19: C 2225_M; UniqueId: cc82bf2c2e22e605; AddInBom: yes; OriginModelName: C 0603; Device: C; 联系售后，技术支持: https://shop463601444.taobao.com; 唯一出售店铺网址: https://shop463601444.taobao.com; DesignItemID: C; LibraryName: 0.1 - 电阻-电容-电感; SymbolName: C; FootprintName: C 0603_L
C205 = C: 贴片电容; BOM名称: 无极性贴片电容; 淘宝ID: 封装库来自淘宝 ID：黄晶宝石; Origin Footprint: C 0201_L; OriginFootprint 2: C 0402_L; OriginFootprint 3: C 0805_L; OriginFootprint 4: C 1206_L; OriginFootprint 5: C 1210_L; OriginFootprint 6: C 1808_L; OriginFootprint 7: C 1812_L; OriginFootprint 8: C 1825_L; OriginFootprint 9: C 2225_L; OriginFootprint 10: C 0201_M; OriginFootprint 11: C 0402_M; OriginFootprint 12: C 0603_M; OriginFootprint 13: C 0805_M; OriginFootprint 14: C 1206_M; OriginFootprint 15: C 1210_M; OriginFootprint 16: C 1808_M; OriginFootprint 17: C 1812_M; OriginFootprint 18: C 1825_M; OriginFootprint 19: C 2225_M; UniqueId: ab4a8fe24fad9fe4; AddInBom: yes; OriginModelName: C 0603; Device: C; 联系售后，技术支持: https://shop463601444.taobao.com; 唯一出售店铺网址: https://shop463601444.taobao.com; DesignItemID: C; LibraryName: 0.1 - 电阻-电容-电感; SymbolName: C; FootprintName: C 0603_L
C206 = C: 贴片电容; BOM名称: 无极性贴片电容; 淘宝ID: 封装库来自淘宝 ID：黄晶宝石; Origin Footprint: C 0201_L; OriginFootprint 2: C 0402_L; OriginFootprint 3: C 0805_L; OriginFootprint 4: C 1206_L; OriginFootprint 5: C 1210_L; OriginFootprint 6: C 1808_L; OriginFootprint 7: C 1812_L; OriginFootprint 8: C 1825_L; OriginFootprint 9: C 2225_L; OriginFootprint 10: C 0201_M; OriginFootprint 11: C 0402_M; OriginFootprint 12: C 0603_M; OriginFootprint 13: C 0805_M; OriginFootprint 14: C 1206_M; OriginFootprint 15: C 1210_M; OriginFootprint 16: C 1808_M; OriginFootprint 17: C 1812_M; OriginFootprint 18: C 1825_M; OriginFootprint 19: C 2225_M; UniqueId: deb55bbe20a101cf; AddInBom: yes; OriginModelName: C 0603; Device: C; 联系售后，技术支持: https://shop463601444.taobao.com; 唯一出售店铺网址: https://shop463601444.taobao.com; DesignItemID: C; LibraryName: 0.1 - 电阻-电容-电感; SymbolName: C; FootprintName: C 0603_L
C207 = C: 贴片电容; BOM名称: 无极性贴片电容; 淘宝ID: 封装库来自淘宝 ID：黄晶宝石; Origin Footprint: C 0201_L; OriginFootprint 2: C 0402_L; OriginFootprint 3: C 0805_L; OriginFootprint 4: C 1206_L; OriginFootprint 5: C 1210_L; OriginFootprint 6: C 1808_L; OriginFootprint 7: C 1812_L; OriginFootprint 8: C 1825_L; OriginFootprint 9: C 2225_L; OriginFootprint 10: C 0201_M; OriginFootprint 11: C 0402_M; OriginFootprint 12: C 0603_M; OriginFootprint 13: C 0805_M; OriginFootprint 14: C 1206_M; OriginFootprint 15: C 1210_M; OriginFootprint 16: C 1808_M; OriginFootprint 17: C 1812_M; OriginFootprint 18: C 1825_M; OriginFootprint 19: C 2225_M; UniqueId: 6827ca7a6bd67e26; AddInBom: yes; OriginModelName: C 0603; Device: C; 联系售后，技术支持: https://shop463601444.taobao.com; 唯一出售店铺网址: https://shop463601444.taobao.com; DesignItemID: C; LibraryName: 0.1 - 电阻-电容-电感; SymbolName: C; FootprintName: C 0603_L
C208 = C: 贴片电容; BOM名称: 无极性贴片电容; 淘宝ID: 封装库来自淘宝 ID：黄晶宝石; Origin Footprint: C 0201_L; OriginFootprint 2: C 0402_L; OriginFootprint 3: C 0805_L; OriginFootprint 4: C 1206_L; OriginFootprint 5: C 1210_L; OriginFootprint 6: C 1808_L; OriginFootprint 7: C 1812_L; OriginFootprint 8: C 1825_L; OriginFootprint 9: C 2225_L; OriginFootprint 10: C 0201_M; OriginFootprint 11: C 0402_M; OriginFootprint 12: C 0603_M; OriginFootprint 13: C 0805_M; OriginFootprint 14: C 1206_M; OriginFootprint 15: C 1210_M; OriginFootprint 16: C 1808_M; OriginFootprint 17: C 1812_M; OriginFootprint 18: C 1825_M; OriginFootprint 19: C 2225_M; UniqueId: 9b91e7356bb9865f; AddInBom: yes; OriginModelName: C 0603; Device: C; 联系售后，技术支持: https://shop463601444.taobao.com; 唯一出售店铺网址: https://shop463601444.taobao.com; DesignItemID: C; LibraryName: 0.1 - 电阻-电容-电感; SymbolName: C; FootprintName: C 0603_L
C209 = C: 贴片电容; BOM名称: 无极性贴片电容; 淘宝ID: 封装库来自淘宝 ID：黄晶宝石; Origin Footprint: C 0201_L; OriginFootprint 2: C 0402_L; OriginFootprint 3: C 0805_L; OriginFootprint 4: C 1206_L; OriginFootprint 5: C 1210_L; OriginFootprint 6: C 1808_L; OriginFootprint 7: C 1812_L; OriginFootprint 8: C 1825_L; OriginFootprint 9: C 2225_L; OriginFootprint 10: C 0201_M; OriginFootprint 11: C 0402_M; OriginFootprint 12: C 0603_M; OriginFootprint 13: C 0805_M; OriginFootprint 14: C 1206_M; OriginFootprint 15: C 1210_M; OriginFootprint 16: C 1808_M; OriginFootprint 17: C 1812_M; OriginFootprint 18: C 1825_M; OriginFootprint 19: C 2225_M; UniqueId: 4b556904310d1556; AddInBom: yes; OriginModelName: C 0603; Device: C; 联系售后，技术支持: https://shop463601444.taobao.com; 唯一出售店铺网址: https://shop463601444.taobao.com; DesignItemID: C; LibraryName: 0.1 - 电阻-电容-电感; SymbolName: C; FootprintName: C 0603_L
C210 = C: 贴片电容; BOM名称: 无极性贴片电容; 淘宝ID: 封装库来自淘宝 ID：黄晶宝石; Origin Footprint: C 0201_L; OriginFootprint 2: C 0402_L; OriginFootprint 3: C 0805_L; OriginFootprint 4: C 1206_L; OriginFootprint 5: C 1210_L; OriginFootprint 6: C 1808_L; OriginFootprint 7: C 1812_L; OriginFootprint 8: C 1825_L; OriginFootprint 9: C 2225_L; OriginFootprint 10: C 0201_M; OriginFootprint 11: C 0402_M; OriginFootprint 12: C 0603_M; OriginFootprint 13: C 0805_M; OriginFootprint 14: C 1206_M; OriginFootprint 15: C 1210_M; OriginFootprint 16: C 1808_M; OriginFootprint 17: C 1812_M; OriginFootprint 18: C 1825_M; OriginFootprint 19: C 2225_M; UniqueId: af7046427a4bfdfb; AddInBom: yes; OriginModelName: C 0603; Device: C; 联系售后，技术支持: https://shop463601444.taobao.com; 唯一出售店铺网址: https://shop463601444.taobao.com; DesignItemID: C; LibraryName: 0.1 - 电阻-电容-电感; SymbolName: C; FootprintName: C 0603_L
C211 = C: 贴片电容; BOM名称: 无极性贴片电容; 淘宝ID: 封装库来自淘宝 ID：黄晶宝石; Origin Footprint: C 0201_L; OriginFootprint 2: C 0402_L; OriginFootprint 3: C 0805_L; OriginFootprint 4: C 1206_L; OriginFootprint 5: C 1210_L; OriginFootprint 6: C 1808_L; OriginFootprint 7: C 1812_L; OriginFootprint 8: C 1825_L; OriginFootprint 9: C 2225_L; OriginFootprint 10: C 0201_M; OriginFootprint 11: C 0402_M; OriginFootprint 12: C 0603_M; OriginFootprint 13: C 0805_M; OriginFootprint 14: C 1206_M; OriginFootprint 15: C 1210_M; OriginFootprint 16: C 1808_M; OriginFootprint 17: C 1812_M; OriginFootprint 18: C 1825_M; OriginFootprint 19: C 2225_M; UniqueId: 65328433fb04ddb7; AddInBom: yes; OriginModelName: C 0603; Device: C; 联系售后，技术支持: https://shop463601444.taobao.com; 唯一出售店铺网址: https://shop463601444.taobao.com; DesignItemID: C; LibraryName: 0.1 - 电阻-电容-电感; SymbolName: C; FootprintName: C 0603_L
CON1 = Header 2: 2P接插件; 版权归属: 封装库来自淘宝卖家 ID：黄晶宝石; BOM名称: 2P接插件; 学习资源: https://shop463601444.taobao.com
D1 = DIODE BI-DIR TRIG
D2 = smbj33a_c224019: 极性:单向;反向截止电压(Vrwm):33V;钳位电压:53.3V;峰值脉冲电流(Ipp):11.3A@10/1000us;峰值脉冲功率(Ppp):600W@10/1000us;击穿电压:40.6V;; Manufacturer: Littelfuse(美国力特); AddInBom: yes; ModelId: 5e8926c661484ff2a35b83e5ae62aeb9; ModelTransform: 212.598,141.732,0,0,0,0,0,0,0; Polarity: 单向; Reverse Stand-Off Voltage (Vrwm): 33V; Clamping Voltage: 53.3V; Voltage - Breakdown: 40.6V; Reverse Leakage Current (Ir): 1uA; level of protection: IEC 61000-4-4；IEC 61000-4-2; Type: TVS; Symbol: SMBJ33A_C224019; LCSC Part Name: SMBJ33A; SupplierPart: C224019; ManufacturerPart: SMBJ33A; Supplier Footprint: SMB(DO-214AA); JLCPCB Part Class: Extended Part; Datasheet: https://item.szlcsc.com/datasheet/SMBJ33A/224167.html; Supplier: LCSC; ConvertToPcb: yes; FootprintName: SMB_L4.6-W3.6-LS5.3-RD; ModelName: SMB_L4.6-W3.6-LS5.3-RD; Peak Pulse Current (Ipp): 11.3A@10/1000us; Peak Pulse Power Dissipation (Ppp): 600W@10/1000us; Operating Temperature: -65℃~+150℃
D3 = BZT52C24_C571382: BOM_Manufacturer: High Diode; Contributor: LCSC; BOM_Supplier: LCSC; BOM_Supplier Part: C571382; BOM_Manufacturer Part: BZT52C24; BOM_JLCPCB Part Class: Extended Part; spicePre: D; spiceSymbolName: BZT52C24_C571382
F1 = FUSE
F2 = TRB300: BOM_Manufacturer: TLC Electronic; Contributor: LCSC; BOM_Supplier: LCSC; BOM_Supplier Part: C262070; BOM_Manufacturer Part: TRB300; BOM_JLCPCB Part Class: Extended Part; spicePre: F; spiceSymbolName: TRB300
J1-J4 = 2X30PIN
J5 = 2X5PIN
J6 J7 = Header 2: 2P接插件; 版权归属: 封装库来自淘宝 ID：黄晶宝石; 技术支持，联系售后: 封装库来自淘宝卖家 ID：黄晶宝石; BOM名称: 2P接插件; 联系售后: https://shop463601444.taobao.com
J10 = Header 12X2: 12*2P接插件; 版权归属: 封装库来自淘宝卖家 ID：黄晶宝石; BOM名称: 12*2P接插件; 学习资源: https://shop463601444.taobao.com
JP1 = Header 3X2: 3*2P接插件; 版权归属: 封装库来自淘宝 ID：黄晶宝石; BOM名称: 3*2P接插件; 学习资源: https://shop463601444.taobao.com
JP2 = Header 2: 2P接插件; 版权归属: 封装库来自淘宝 ID：黄晶宝石; Origin Footprint: XH2.54-WI-2P; OriginFootprint 2: XH2.54-LI-2P; OriginFootprint 3: HDR2.54-M-LI-2P; OriginFootprint 4: HDR2.54-WI-2P; OriginFootprint 5: HDR2.54-WS-2P; OriginFootprint 7: HDR2.54-M-WS-2P; OriginFootprint 8: KF2510-LI-2P; OriginFootprint 9: XH2.54-WS-2P; OriginFootprint 10: XH2.54-LS-2P; OriginFootprint 11: KF2EDGK-2.54-LI-2P; OriginFootprint 12: KF2EDGK-2.54-WI-2P; UniqueId: 307b99641c701ee0; AddInBom: yes; OriginModelName: HDR2.54-1P; Device: Header 2; BOM名称: 2P接插件; 联系售后: https://shop463601444.taobao.com; OriginFootprint 6: HDR2.54-Y-LI-2P; DesignItemID: Header 2; LibraryName: 5.4 - 接插件-脚距2.54 (100mil); SymbolName: Header 2; FootprintName: HDR2.54-LI-2P
JP3 = Header 2: 2P接插件; 版权归属: 封装库来自淘宝 ID：黄晶宝石; Origin Footprint: XH2.54-WI-2P; OriginFootprint 2: XH2.54-LI-2P; OriginFootprint 3: HDR2.54-M-LI-2P; OriginFootprint 4: HDR2.54-WI-2P; OriginFootprint 5: HDR2.54-WS-2P; OriginFootprint 7: HDR2.54-M-WS-2P; OriginFootprint 8: KF2510-LI-2P; OriginFootprint 9: XH2.54-WS-2P; OriginFootprint 10: XH2.54-LS-2P; OriginFootprint 11: KF2EDGK-2.54-LI-2P; OriginFootprint 12: KF2EDGK-2.54-WI-2P; UniqueId: 62dfc6d8d4781687; AddInBom: yes; OriginModelName: HDR2.54-1P; Device: Header 2; BOM名称: 2P接插件; 联系售后: https://shop463601444.taobao.com; OriginFootprint 6: HDR2.54-Y-LI-2P; DesignItemID: Header 2; LibraryName: 5.4 - 接插件-脚距2.54 (100mil); SymbolName: Header 2; FootprintName: HDR2.54-LI-2P
JP4 = Header 2: 2P接插件; 版权归属: 封装库来自淘宝 ID：黄晶宝石; Origin Footprint: XH2.54-WI-2P; OriginFootprint 2: XH2.54-LI-2P; OriginFootprint 3: HDR2.54-M-LI-2P; OriginFootprint 4: HDR2.54-WI-2P; OriginFootprint 5: HDR2.54-WS-2P; OriginFootprint 7: HDR2.54-M-WS-2P; OriginFootprint 8: KF2510-LI-2P; OriginFootprint 9: XH2.54-WS-2P; OriginFootprint 10: XH2.54-LS-2P; OriginFootprint 11: KF2EDGK-2.54-LI-2P; OriginFootprint 12: KF2EDGK-2.54-WI-2P; UniqueId: 7db8ea879d3067b5; AddInBom: yes; OriginModelName: HDR2.54-1P; Device: Header 2; BOM名称: 2P接插件; 联系售后: https://shop463601444.taobao.com; OriginFootprint 6: HDR2.54-Y-LI-2P; DesignItemID: Header 2; LibraryName: 5.4 - 接插件-脚距2.54 (100mil); SymbolName: Header 2; FootprintName: HDR2.54-LI-2P
JP5 = Header 2: 2P接插件; 版权归属: 封装库来自淘宝 ID：黄晶宝石; Origin Footprint: XH2.54-WI-2P; OriginFootprint 2: XH2.54-LI-2P; OriginFootprint 3: HDR2.54-M-LI-2P; OriginFootprint 4: HDR2.54-WI-2P; OriginFootprint 5: HDR2.54-WS-2P; OriginFootprint 7: HDR2.54-M-WS-2P; OriginFootprint 8: KF2510-LI-2P; OriginFootprint 9: XH2.54-WS-2P; OriginFootprint 10: XH2.54-LS-2P; OriginFootprint 11: KF2EDGK-2.54-LI-2P; OriginFootprint 12: KF2EDGK-2.54-WI-2P; UniqueId: fa82831371ccd6d5; AddInBom: yes; OriginModelName: HDR2.54-1P; Device: Header 2; BOM名称: 2P接插件; 联系售后: https://shop463601444.taobao.com; OriginFootprint 6: HDR2.54-Y-LI-2P; DesignItemID: Header 2; LibraryName: 5.4 - 接插件-脚距2.54 (100mil); SymbolName: Header 2; FootprintName: HDR2.54-LI-2P
JP6 = Header 2: 2P接插件; 版权归属: 封装库来自淘宝 ID：黄晶宝石; Origin Footprint: XH2.54-WI-2P; OriginFootprint 2: XH2.54-LI-2P; OriginFootprint 3: HDR2.54-M-LI-2P; OriginFootprint 4: HDR2.54-WI-2P; OriginFootprint 5: HDR2.54-WS-2P; OriginFootprint 7: HDR2.54-M-WS-2P; OriginFootprint 8: KF2510-LI-2P; OriginFootprint 9: XH2.54-WS-2P; OriginFootprint 10: XH2.54-LS-2P; OriginFootprint 11: KF2EDGK-2.54-LI-2P; OriginFootprint 12: KF2EDGK-2.54-WI-2P; UniqueId: 6910556eac3a76a2; AddInBom: yes; OriginModelName: HDR2.54-1P; Device: Header 2; BOM名称: 2P接插件; 联系售后: https://shop463601444.taobao.com; OriginFootprint 6: HDR2.54-Y-LI-2P; DesignItemID: Header 2; LibraryName: 5.4 - 接插件-脚距2.54 (100mil); SymbolName: Header 2; FootprintName: HDR2.54-LI-2P
JP7 = Header 2: 2P接插件; 版权归属: 封装库来自淘宝 ID：黄晶宝石; Origin Footprint: XH2.54-WI-2P; OriginFootprint 2: XH2.54-LI-2P; OriginFootprint 3: HDR2.54-M-LI-2P; OriginFootprint 4: HDR2.54-WI-2P; OriginFootprint 5: HDR2.54-WS-2P; OriginFootprint 7: HDR2.54-M-WS-2P; OriginFootprint 8: KF2510-LI-2P; OriginFootprint 9: XH2.54-WS-2P; OriginFootprint 10: XH2.54-LS-2P; OriginFootprint 11: KF2EDGK-2.54-LI-2P; OriginFootprint 12: KF2EDGK-2.54-WI-2P; UniqueId: 1e4a53fbbd604e66; AddInBom: yes; OriginModelName: HDR2.54-1P; Device: Header 2; BOM名称: 2P接插件; 联系售后: https://shop463601444.taobao.com; OriginFootprint 6: HDR2.54-Y-LI-2P; DesignItemID: Header 2; LibraryName: 5.4 - 接插件-脚距2.54 (100mil); SymbolName: Header 2; FootprintName: HDR2.54-LI-2P
JP8 = Header 2: 2P接插件; 版权归属: 封装库来自淘宝 ID：黄晶宝石; Origin Footprint: XH2.54-WI-2P; OriginFootprint 2: XH2.54-LI-2P; OriginFootprint 3: HDR2.54-M-LI-2P; OriginFootprint 4: HDR2.54-WI-2P; OriginFootprint 5: HDR2.54-WS-2P; OriginFootprint 7: HDR2.54-M-WS-2P; OriginFootprint 8: KF2510-LI-2P; OriginFootprint 9: XH2.54-WS-2P; OriginFootprint 10: XH2.54-LS-2P; OriginFootprint 11: KF2EDGK-2.54-LI-2P; OriginFootprint 12: KF2EDGK-2.54-WI-2P; UniqueId: 6655918135225170; AddInBom: yes; OriginModelName: HDR2.54-1P; Device: Header 2; BOM名称: 2P接插件; 联系售后: https://shop463601444.taobao.com; OriginFootprint 6: HDR2.54-Y-LI-2P; DesignItemID: Header 2; LibraryName: 5.4 - 接插件-脚距2.54 (100mil); SymbolName: Header 2; FootprintName: HDR2.54-LI-2P
JP9 = Header 2: 2P接插件; 版权归属: 封装库来自淘宝 ID：黄晶宝石; Origin Footprint: XH2.54-WI-2P; OriginFootprint 2: XH2.54-LI-2P; OriginFootprint 3: HDR2.54-M-LI-2P; OriginFootprint 4: HDR2.54-WI-2P; OriginFootprint 5: HDR2.54-WS-2P; OriginFootprint 7: HDR2.54-M-WS-2P; OriginFootprint 8: KF2510-LI-2P; OriginFootprint 9: XH2.54-WS-2P; OriginFootprint 10: XH2.54-LS-2P; OriginFootprint 11: KF2EDGK-2.54-LI-2P; OriginFootprint 12: KF2EDGK-2.54-WI-2P; UniqueId: 4577e3d3da87c365; AddInBom: yes; OriginModelName: HDR2.54-1P; Device: Header 2; BOM名称: 2P接插件; 联系售后: https://shop463601444.taobao.com; OriginFootprint 6: HDR2.54-Y-LI-2P; DesignItemID: Header 2; LibraryName: 5.4 - 接插件-脚距2.54 (100mil); SymbolName: Header 2; FootprintName: HDR2.54-LI-2P
JP10 = Header 2: 2P接插件; 版权归属: 封装库来自淘宝 ID：黄晶宝石; Origin Footprint: XH2.54-WI-2P; OriginFootprint 2: XH2.54-LI-2P; OriginFootprint 3: HDR2.54-M-LI-2P; OriginFootprint 4: HDR2.54-WI-2P; OriginFootprint 5: HDR2.54-WS-2P; OriginFootprint 7: HDR2.54-M-WS-2P; OriginFootprint 8: KF2510-LI-2P; OriginFootprint 9: XH2.54-WS-2P; OriginFootprint 10: XH2.54-LS-2P; OriginFootprint 11: KF2EDGK-2.54-LI-2P; OriginFootprint 12: KF2EDGK-2.54-WI-2P; UniqueId: 85e96206a86bca40; AddInBom: yes; OriginModelName: HDR2.54-1P; Device: Header 2; BOM名称: 2P接插件; 联系售后: https://shop463601444.taobao.com; OriginFootprint 6: HDR2.54-Y-LI-2P; DesignItemID: Header 2; LibraryName: 5.4 - 接插件-脚距2.54 (100mil); SymbolName: Header 2; FootprintName: HDR2.54-LI-2P
JP11 = Header 2: 2P接插件; 版权归属: 封装库来自淘宝 ID：黄晶宝石; Origin Footprint: XH2.54-WI-2P; OriginFootprint 2: XH2.54-LI-2P; OriginFootprint 3: HDR2.54-M-LI-2P; OriginFootprint 4: HDR2.54-WI-2P; OriginFootprint 5: HDR2.54-WS-2P; OriginFootprint 7: HDR2.54-M-WS-2P; OriginFootprint 8: KF2510-LI-2P; OriginFootprint 9: XH2.54-WS-2P; OriginFootprint 10: XH2.54-LS-2P; OriginFootprint 11: KF2EDGK-2.54-LI-2P; OriginFootprint 12: KF2EDGK-2.54-WI-2P; UniqueId: ddeec7be49001c93; AddInBom: yes; OriginModelName: HDR2.54-1P; Device: Header 2; BOM名称: 2P接插件; 联系售后: https://shop463601444.taobao.com; OriginFootprint 6: HDR2.54-Y-LI-2P; DesignItemID: Header 2; LibraryName: 5.4 - 接插件-脚距2.54 (100mil); SymbolName: Header 2; FootprintName: HDR2.54-LI-2P